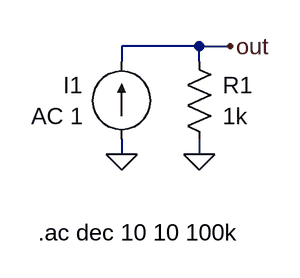
[diagram p0: schematic tia.asc]
tia.asc, the LTspice schematic file:
Version 4
SHEET 1 880 680
WIRE 160 176 160 192
WIRE 240 176 240 192
WIRE 240 96 240 80
WIRE 240 80 160 80
WIRE 160 80 160 96
WIRE 240 80 272 80
FLAG 160 192 0
FLAG 240 192 0
FLAG 272 80 out
SYMBOL current 160 176 M180
WINDOW 0 -40 56 Right 2
WINDOW 3 -40 24 Right 2
SYMATTR InstName I1
SYMATTR Value AC 1
SYMBOL res 224 80 R0
WINDOW 0 40 40 Left 2
WINDOW 3 40 72 Left 2
SYMATTR InstName R1
SYMATTR Value 1k
TEXT 74 272 Left 2 !.ac dec 10 10 100k

The netlist it stands for:
* tia.asc
I1 0 out AC 1
R1 out 0 1k
.ac dec 10 10 100k
.backanno
.end